# Altium project Proyecto3.PrjPcb
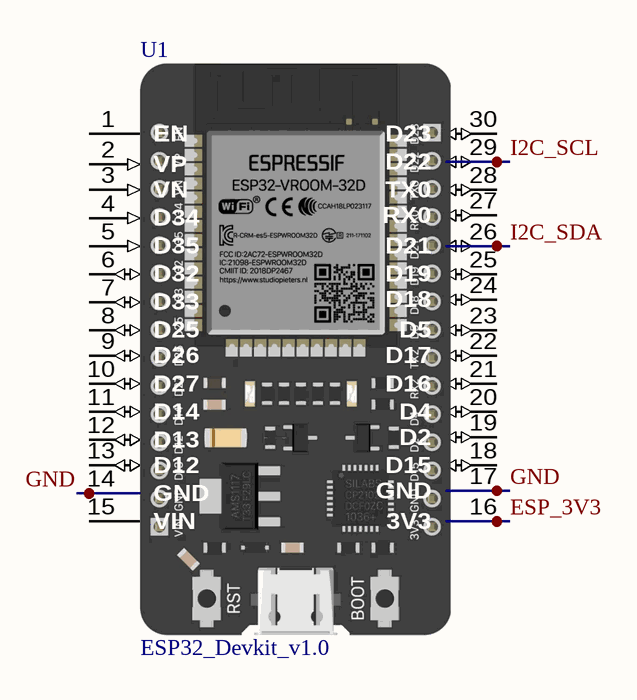
[diagram p0: 01_ESP32_Maestro.SchDoc]
5 sheets, 38 parts. Net scope: global (net labels, ports and power ports of the same name join across sheets).
Sheets:
  01_ESP32_Maestro.SchDoc
  02_Nucleo_1.SchDoc
  03_Nucleo_2.SchDoc
  04_TFT_Display_NeoPixel.SchDoc
  05_LEDs_Alimentacion.SchDoc

## Sheet 01_ESP32_Maestro.SchDoc: 01_ESP32_Maestro.SchDoc
size Letter; Author: Miguel Donis; Organization: Altium Limited; Address1: L3, 12a Rodborough Rd; Address2: Frenchs Forest; Address3: NSW; Address4: Australia 2086; Revision: 1.0; SheetNumber: 1; SheetTotal: 5; Carnet: 22993; Curso: Digital 2; ProjectName: proyecto 3

### Parts
U1  ESP32_Devkit_v1.0  [ESP_32_DEKIT_V1.0]

### Nets
ESP_3V3: U1.16(3V3)
GND: U1.14(GND) U1.17(GND)
I2C_SCL: U1.29(D22)
I2C_SDA: U1.26(D21)

Not connected (* = marked no-connect by the designer): U1 1(EN) 2(VP) 3(VN) 4(D34) 5(D35) 6(D32) 7(D33) 8(D25) 9(D26) 10(D27) 11(D14) 12(D13) 13(D12) 15(VIN) 18(D15) 19(D2) 20(D4) 21(D16) 22(D17) 23(D5) 24(D18) 25(D19) 27(RX0) 28(TX0) 30(D23)

### Notes on the sheet
- Proyecto:
- Autor:
- Documento:
- Carnet:
- Curso:
- Revision:
- Fecha:
- Tamaño:
- Carta
- Hoja:
- De:

### Library data of the parts
U1 = ESP32_Devkit_v1.0: ESP32 Development kit v1.0

## Sheet 02_Nucleo_1.SchDoc: 02_Nucleo_1.SchDoc
size Letter; Author: Miguel Donis; Organization: Altium Limited; Address1: L3, 12a Rodborough Rd; Address2: Frenchs Forest; Address3: NSW; Address4: Australia 2086; Revision: 1.0; SheetNumber: 2; SheetTotal: 5; Carnet: 22993; Curso: Digital 2; ProjectName: proyecto 3
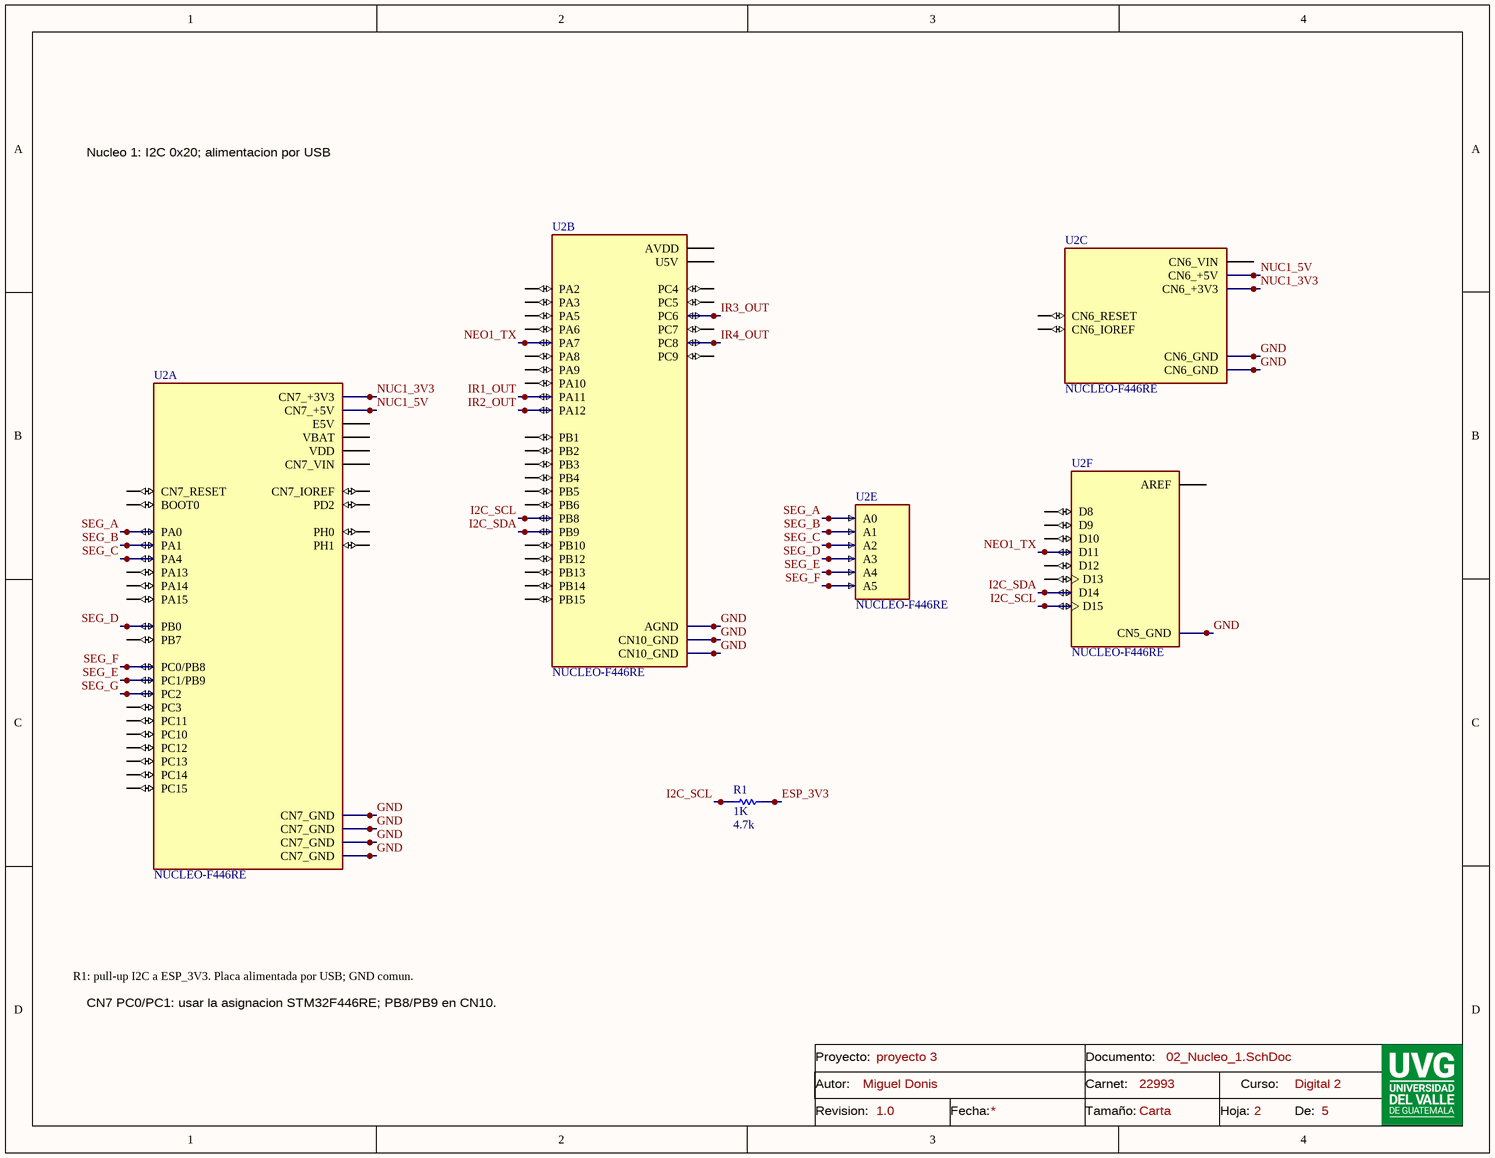
[diagram p1: 02_Nucleo_1.SchDoc]

### Parts
R1  4.7k  value 1K  [AXIAL-0.3]
U2  NUCLEO-F446RE  [MODULE_NUCLEO-F446RE]  (parts A,B,C,E,F of 6)

### Nets
ESP_3V3: R1.2
GND: U2.CN5_7(CN5_GND) U2.CN6_6(CN6_GND) U2.CN6_7(CN6_GND) U2.CN7_8(CN7_GND) U2.CN7_19(CN7_GND) U2.CN7_20(CN7_GND) U2.CN7_22(CN7_GND) U2.CN10_9(CN10_GND) U2.CN10_20(CN10_GND) U2.CN10_32(AGND)
I2C_SCL: R1.1 U2.CN5_10(D15) U2.CN10_3(PB8)
I2C_SDA: U2.CN5_9(D14) U2.CN10_5(PB9)
IR1_OUT: U2.CN10_14(PA11)
IR2_OUT: U2.CN10_12(PA12)
IR3_OUT: U2.CN10_4(PC6)
IR4_OUT: U2.CN10_2(PC8)
NEO1_TX: U2.CN5_4(D11) U2.CN10_15(PA7)
NUC1_3V3: U2.CN6_4(CN6_+3V3) U2.CN7_16(CN7_+3V3)
NUC1_5V: U2.CN6_5(CN6_+5V) U2.CN7_18(CN7_+5V)
SEG_A: U2.CN7_28(PA0) U2.CN8_1(A0)
SEG_B: U2.CN7_30(PA1) U2.CN8_2(A1)
SEG_C: U2.CN7_32(PA4) U2.CN8_3(A2)
SEG_D: U2.CN7_34(PB0) U2.CN8_4(A3)
SEG_E: U2.CN7_36(PC1/PB9) U2.CN8_5(A4)
SEG_F: U2.CN7_38(PC0/PB8) U2.CN8_6(A5)
SEG_G: U2.CN7_35(PC2)

Not connected (* = marked no-connect by the designer): U2 CN5_1(D8) CN5_2(D9) CN5_3(D10) CN5_5(D12) CN5_6(D13) CN5_8(AREF) CN6_2(CN6_IOREF) CN6_3(CN6_RESET) CN6_8(CN6_VIN) CN7_1(PC10) CN7_2(PC11) CN7_3(PC12) CN7_4(PD2) CN7_5(VDD) CN7_6(E5V) CN7_7(BOOT0) CN7_12(CN7_IOREF) CN7_13(PA13) CN7_14(CN7_RESET) CN7_15(PA14) CN7_17(PA15) CN7_21(PB7) CN7_23(PC13) CN7_24(CN7_VIN) CN7_25(PC14) CN7_27(PC15) CN7_29(PH0) CN7_31(PH1) CN7_33(VBAT) CN7_37(PC3) CN10_1(PC9) CN10_6(PC5) CN10_7(AVDD) CN10_8(U5V) CN10_11(PA5) CN10_13(PA6) CN10_16(PB12) CN10_17(PB6) CN10_19(PC7) CN10_21(PA9) CN10_22(PB2) CN10_23(PA8) CN10_24(PB1) CN10_25(PB10) CN10_26(PB15) CN10_27(PB4) CN10_28(PB14) CN10_29(PB5) CN10_30(PB13) CN10_31(PB3) CN10_33(PA10) CN10_34(PC4) CN10_35(PA2) CN10_37(PA3)

### Notes on the sheet
- Nucleo 1: I2C 0x20; alimentacion por USB
- R1: pull-up I2C a ESP_3V3. Placa alimentada por USB; GND comun.
- CN7 PC0/PC1: usar la asignacion STM32F446RE; PB8/PB9 en CN10.
- Proyecto:
- Autor:
- Documento:
- Carnet:
- Curso:
- Revision:
- Fecha:
- Tamaño:
- Carta
- Hoja:
- De:

### Library data of the parts
R1 = Res1: Resistor; Published: 8-Jun-2000; LatestRevisionDate: 17-Jul-2002; LatestRevisionNote: Re-released for DXP Platform.; PackageReference: AXIAL-0.3; Publisher: Altium Limited; PackageDescription: Axial Device, Thru-Hole; 2 Leads; 0.3 in Pin Spacing
U2 = NUCLEO-F446RE: STM32F446RE, mbed-Enabled Development Nucleo-64 STM32F4 ARMÂ® CortexÂ®-M4 MCU 32-Bit Embedded Evaluation Board; MF: STMicroelectronics; SnapEDA_Link: https://www.snapeda.com/parts/NUCLEO-F446RE/STMicroelectronics/view-part/?ref=snap; Package: None; Value: *; MP: NUCLEO-F446RE; Check_prices: https://www.snapeda.com/parts/NUCLEO-F446RE/STMicroelectronics/view-part/?ref=eda

## Sheet 03_Nucleo_2.SchDoc: 03_Nucleo_2.SchDoc
size Letter; Author: Miguel Donis; Organization: Altium Limited; Address1: L3, 12a Rodborough Rd; Address2: Frenchs Forest; Address3: NSW; Address4: Australia 2086; Revision: 1.0; SheetNumber: 3; SheetTotal: 5; Carnet: 22993; Curso: Digital 2; ProjectName: proyecto 3
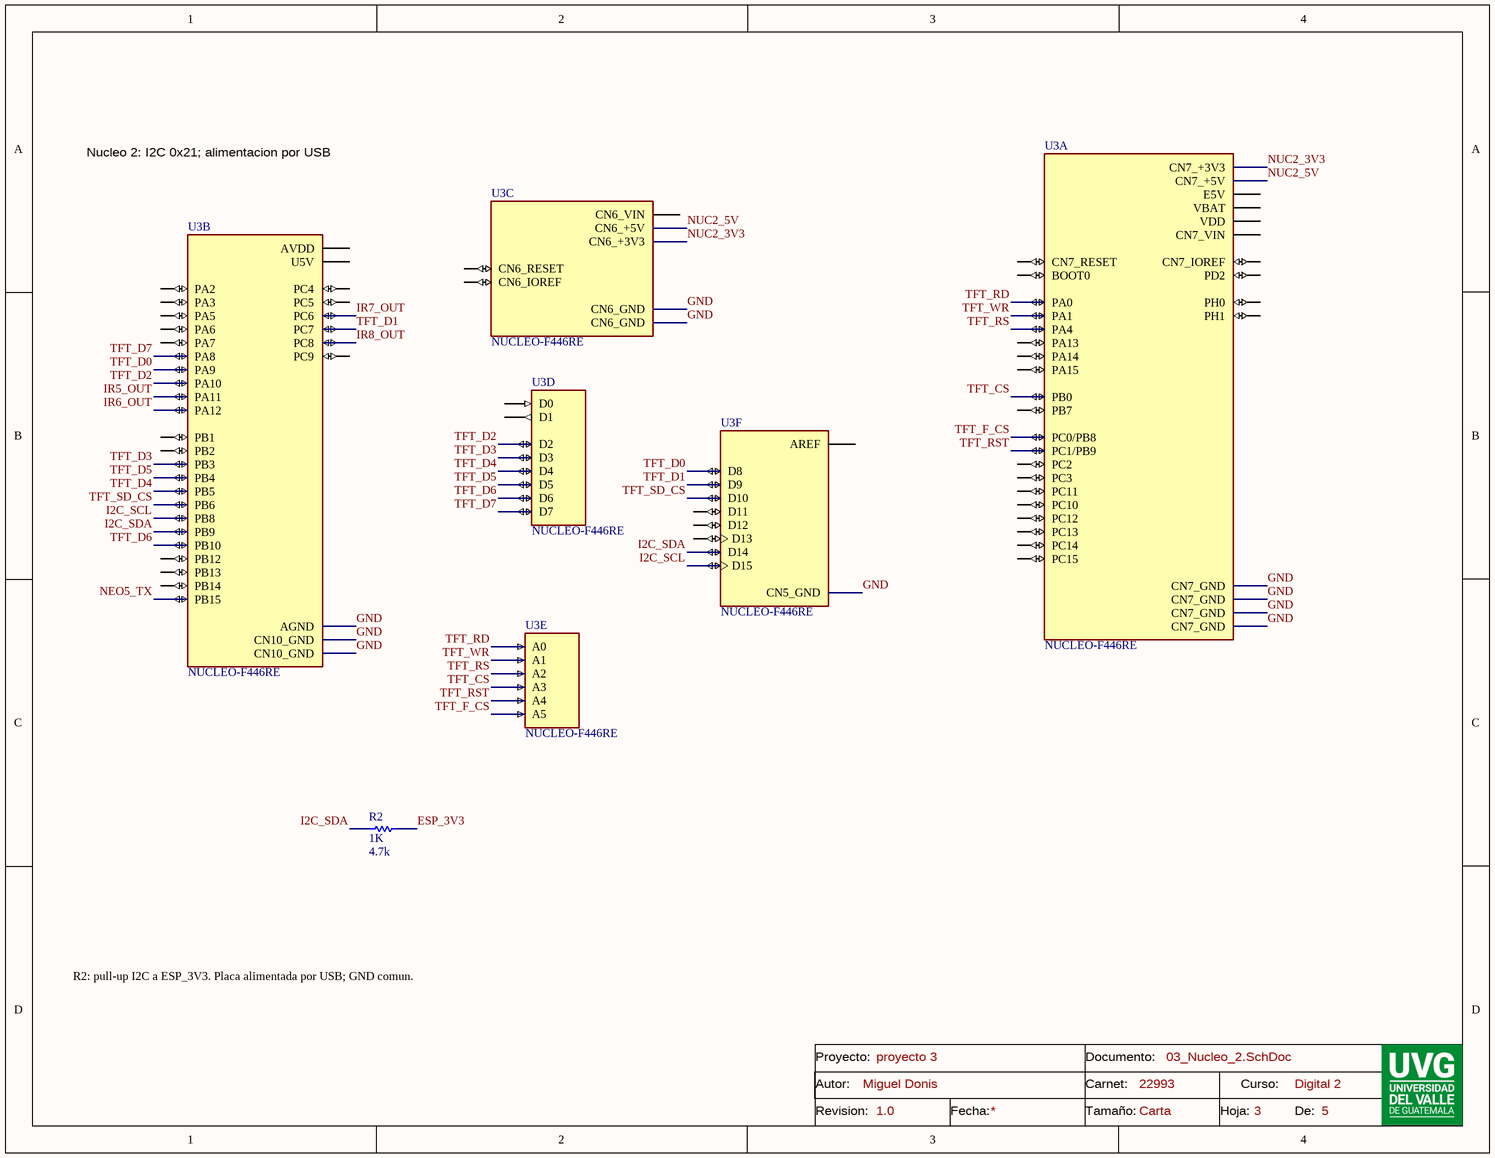
[diagram p2: 03_Nucleo_2.SchDoc]

### Parts
R2  4.7k  value 1K  [AXIAL-0.3]
U3  NUCLEO-F446RE  [MODULE_NUCLEO-F446RE]  (parts A,B,C,D,E,F of 6)

### Nets
ESP_3V3: R2.2
GND: U3.CN5_7(CN5_GND) U3.CN6_6(CN6_GND) U3.CN6_7(CN6_GND) U3.CN7_8(CN7_GND) U3.CN7_19(CN7_GND) U3.CN7_20(CN7_GND) U3.CN7_22(CN7_GND) U3.CN10_9(CN10_GND) U3.CN10_20(CN10_GND) U3.CN10_32(AGND)
I2C_SCL: U3.CN5_10(D15) U3.CN10_3(PB8)
I2C_SDA: R2.1 U3.CN5_9(D14) U3.CN10_5(PB9)
IR5_OUT: U3.CN10_14(PA11)
IR6_OUT: U3.CN10_12(PA12)
IR7_OUT: U3.CN10_4(PC6)
IR8_OUT: U3.CN10_2(PC8)
NEO5_TX: U3.CN10_26(PB15)
NUC2_3V3: U3.CN6_4(CN6_+3V3) U3.CN7_16(CN7_+3V3)
NUC2_5V: U3.CN6_5(CN6_+5V) U3.CN7_18(CN7_+5V)
TFT_CS: U3.CN7_34(PB0) U3.CN8_4(A3)
TFT_D0: U3.CN5_1(D8) U3.CN10_21(PA9)
TFT_D1: U3.CN5_2(D9) U3.CN10_19(PC7)
TFT_D2: U3.CN9_3(D2) U3.CN10_33(PA10)
TFT_D3: U3.CN9_4(D3) U3.CN10_31(PB3)
TFT_D4: U3.CN9_5(D4) U3.CN10_29(PB5)
TFT_D5: U3.CN9_6(D5) U3.CN10_27(PB4)
TFT_D6: U3.CN9_7(D6) U3.CN10_25(PB10)
TFT_D7: U3.CN9_8(D7) U3.CN10_23(PA8)
TFT_F_CS: U3.CN7_38(PC0/PB8) U3.CN8_6(A5)
TFT_RD: U3.CN7_28(PA0) U3.CN8_1(A0)
TFT_RS: U3.CN7_32(PA4) U3.CN8_3(A2)
TFT_RST: U3.CN7_36(PC1/PB9) U3.CN8_5(A4)
TFT_SD_CS: U3.CN5_3(D10) U3.CN10_17(PB6)
TFT_WR: U3.CN7_30(PA1) U3.CN8_2(A1)

Not connected (* = marked no-connect by the designer): U3 CN5_4(D11) CN5_5(D12) CN5_6(D13) CN5_8(AREF) CN6_2(CN6_IOREF) CN6_3(CN6_RESET) CN6_8(CN6_VIN) CN7_1(PC10) CN7_2(PC11) CN7_3(PC12) CN7_4(PD2) CN7_5(VDD) CN7_6(E5V) CN7_7(BOOT0) CN7_12(CN7_IOREF) CN7_13(PA13) CN7_14(CN7_RESET) CN7_15(PA14) CN7_17(PA15) CN7_21(PB7) CN7_23(PC13) CN7_24(CN7_VIN) CN7_25(PC14) CN7_27(PC15) CN7_29(PH0) CN7_31(PH1) CN7_33(VBAT) CN7_35(PC2) CN7_37(PC3) CN9_1(D0) CN9_2(D1) CN10_1(PC9) CN10_6(PC5) CN10_7(AVDD) CN10_8(U5V) CN10_11(PA5) CN10_13(PA6) CN10_15(PA7) CN10_16(PB12) CN10_22(PB2) CN10_24(PB1) CN10_28(PB14) CN10_30(PB13) CN10_34(PC4) CN10_35(PA2) CN10_37(PA3)

### Notes on the sheet
- Nucleo 2: I2C 0x21; alimentacion por USB
- R2: pull-up I2C a ESP_3V3. Placa alimentada por USB; GND comun.
- Proyecto:
- Autor:
- Documento:
- Carnet:
- Curso:
- Revision:
- Fecha:
- Tamaño:
- Carta
- Hoja:
- De:

### Library data of the parts
R2 = Res1: Resistor; Published: 8-Jun-2000; LatestRevisionDate: 17-Jul-2002; LatestRevisionNote: Re-released for DXP Platform.; PackageReference: AXIAL-0.3; Publisher: Altium Limited; PackageDescription: Axial Device, Thru-Hole; 2 Leads; 0.3 in Pin Spacing
U3 = NUCLEO-F446RE: as U2 on sheet 02_Nucleo_1; SnapEDA_Link: https://www.snapeda.com/parts/NUCLEO-F446RE/STMicroelectronics/view-part/?ref=snap; Package: None; Value: *; MP: NUCLEO-F446RE; Check_prices: https://www.snapeda.com/parts/NUCLEO-F446RE/STMicroelectronics/view-part/?ref=eda

## Sheet 04_TFT_Display_NeoPixel.SchDoc: 04_TFT_Display_NeoPixel.SchDoc
size Letter; Author: Miguel Donis; Organization: Altium Limited; Address1: L3, 12a Rodborough Rd; Address2: Frenchs Forest; Address3: NSW; Address4: Australia 2086; Revision: 1.0; SheetNumber: 4; SheetTotal: 5; Carnet: 22993; Curso: Digital 2; ProjectName: proyecto 3
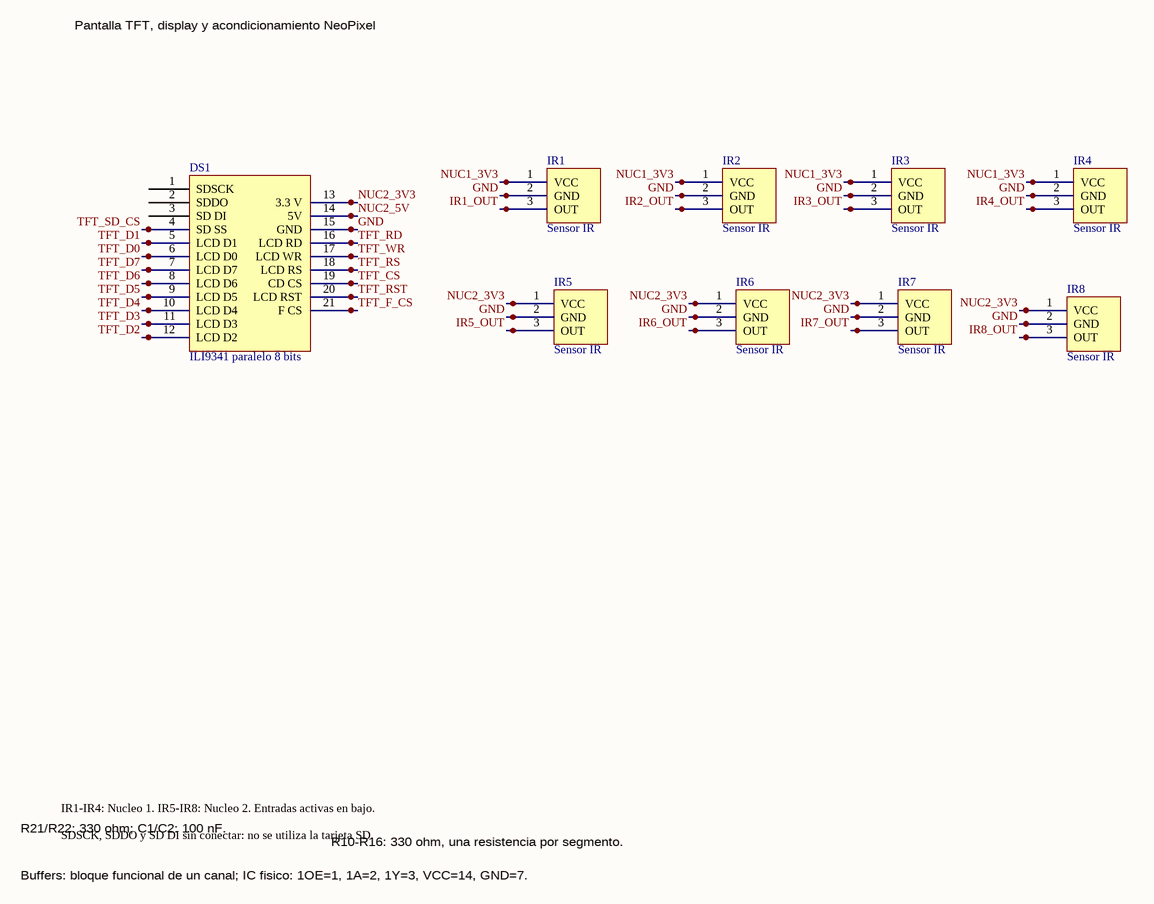
[diagram p3: 04_TFT_Display_NeoPixel.SchDoc]

### Parts
DS1  ILI9341 paralelo 8 bits
IR1  Sensor IR
IR2  Sensor IR
IR3  Sensor IR
IR4  Sensor IR
IR5  Sensor IR
IR6  Sensor IR
IR7  Sensor IR
IR8  Sensor IR

### Nets
GND: DS1.15(GND) IR1.2(GND) IR2.2(GND) IR3.2(GND) IR4.2(GND) IR5.2(GND) IR6.2(GND) IR7.2(GND) IR8.2(GND)
IR1_OUT: IR1.3(OUT)
IR2_OUT: IR2.3(OUT)
IR3_OUT: IR3.3(OUT)
IR4_OUT: IR4.3(OUT)
IR5_OUT: IR5.3(OUT)
IR6_OUT: IR6.3(OUT)
IR7_OUT: IR7.3(OUT)
IR8_OUT: IR8.3(OUT)
NUC1_3V3: IR1.1(VCC) IR2.1(VCC) IR3.1(VCC) IR4.1(VCC)
NUC2_3V3: DS1.13(3.3_V) IR5.1(VCC) IR6.1(VCC) IR7.1(VCC) IR8.1(VCC)
NUC2_5V: DS1.14(5V)
TFT_CS: DS1.19(CD_CS)
TFT_D0: DS1.6(LCD_D0)
TFT_D1: DS1.5(LCD_D1)
TFT_D2: DS1.12(LCD_D2)
TFT_D3: DS1.11(LCD_D3)
TFT_D4: DS1.10(LCD_D4)
TFT_D5: DS1.9(LCD_D5)
TFT_D6: DS1.8(LCD_D6)
TFT_D7: DS1.7(LCD_D7)
TFT_F_CS: DS1.21(F_CS)
TFT_RD: DS1.16(LCD_RD)
TFT_RS: DS1.18(LCD_RS)
TFT_RST: DS1.20(LCD_RST)
TFT_SD_CS: DS1.4(SD_SS)
TFT_WR: DS1.17(LCD_WR)

Not connected (* = marked no-connect by the designer): DS1 1(SDSCK) 2(SDDO) 3(SD_DI)

### Notes on the sheet
- Pantalla TFT, display y acondicionamiento NeoPixel
- R21/R22: 330 ohm; C1/C2: 100 nF.
- IR1-IR4: Nucleo 1. IR5-IR8: Nucleo 2. Entradas activas en bajo.
- SDSCK, SDDO y SD DI sin conectar: no se utiliza la tarjeta SD.
- R10-R16: 330 ohm, una resistencia por segmento.
- Buffers: bloque funcional de un canal; IC fisico: 1OE=1, 1A=2, 1Y=3, VCC=14, GND=7.
- Proyecto:
- Autor:
- Documento:
- Carnet:
- Curso:
- Revision:
- Fecha:
- Tamaño:
- Carta
- Hoja:
- De:

### Library data of the parts
DS1 = ili

## Sheet 05_LEDs_Alimentacion.SchDoc: 05_LEDs_Alimentacion.SchDoc
size Letter; Author: Miguel Donis; Organization: Altium Limited; Address1: L3, 12a Rodborough Rd; Address2: Frenchs Forest; Address3: NSW; Address4: Australia 2086; Revision: 1.0; SheetNumber: 5; SheetTotal: 5; Carnet: 22993; Curso: Digital 2; ProjectName: proyecto 3
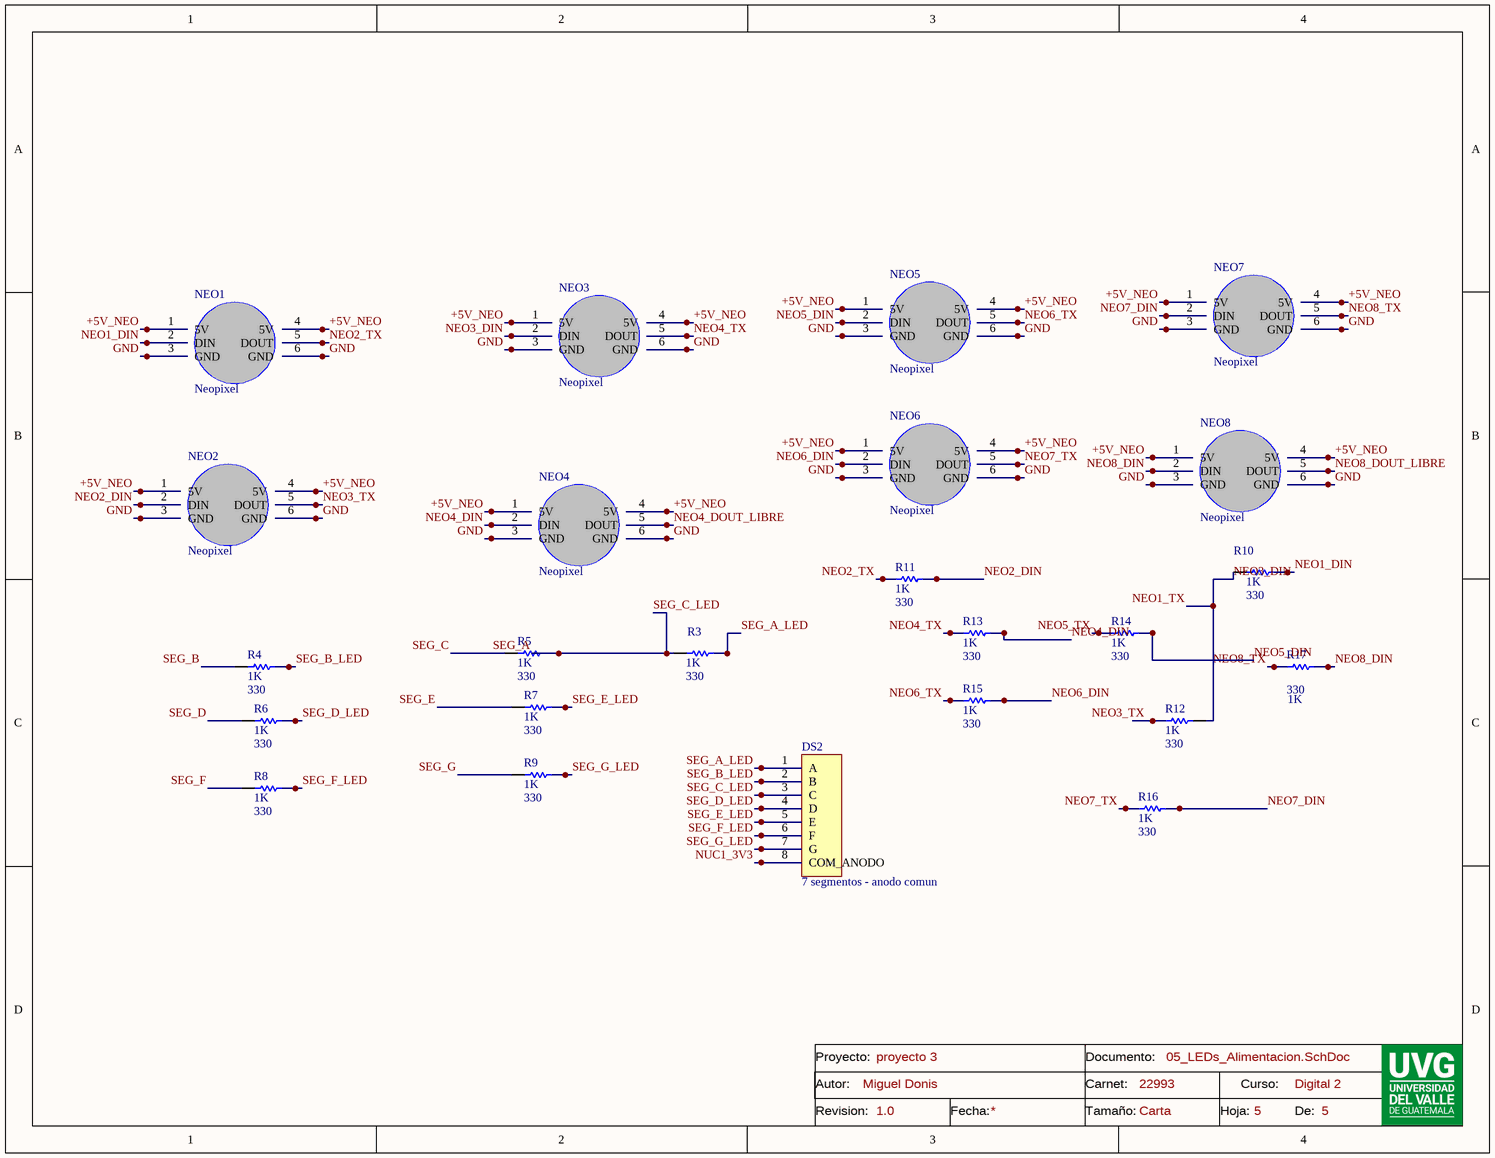
[diagram p4: 05_LEDs_Alimentacion.SchDoc]

### Parts
DS2  7 segmentos - anodo comun
NEO1  Neopixel
NEO2  Neopixel
NEO3  Neopixel
NEO4  Neopixel
NEO5  Neopixel
NEO6  Neopixel
NEO7  Neopixel
NEO8  Neopixel
R3  330  value 1K  [AXIAL-0.3]
R4  330  value 1K  [AXIAL-0.3]
R5  330  value 1K  [AXIAL-0.3]
R6  330  value 1K  [AXIAL-0.3]
R7  330  value 1K  [AXIAL-0.3]
R8  330  value 1K  [AXIAL-0.3]
R9  330  value 1K  [AXIAL-0.3]
R10  330  value 1K  [AXIAL-0.3]
R11  330  value 1K  [AXIAL-0.3]
R12  330  value 1K  [AXIAL-0.3]
R13  330  value 1K  [AXIAL-0.3]
R14  330  value 1K  [AXIAL-0.3]
R15  330  value 1K  [AXIAL-0.3]
R16  330  value 1K  [AXIAL-0.3]
R17  330  value 1K  [AXIAL-0.3]

### Nets
+5V_NEO: NEO1.1(5V) NEO1.4(5V) NEO2.1(5V) NEO2.4(5V) NEO3.1(5V) NEO3.4(5V) NEO4.1(5V) NEO4.4(5V) NEO5.1(5V) NEO5.4(5V) NEO6.1(5V) NEO6.4(5V) NEO7.1(5V) NEO7.4(5V) NEO8.1(5V) NEO8.4(5V)
GND: NEO1.3(GND) NEO1.6(GND) NEO2.3(GND) NEO2.6(GND) NEO3.3(GND) NEO3.6(GND) NEO4.3(GND) NEO4.6(GND) NEO5.3(GND) NEO5.6(GND) NEO6.3(GND) NEO6.6(GND) NEO7.3(GND) NEO7.6(GND) NEO8.3(GND) NEO8.6(GND)
NEO1_DIN: NEO1.2(DIN) R10.2
NEO1_TX: NEO3.2(DIN) R10.1 R12.2  [also labelled NEO3_DIN]
NEO2_DIN: NEO2.2(DIN) R11.2
NEO2_TX: NEO1.5(DOUT) R11.1
NEO3_TX: NEO2.5(DOUT) R12.1
NEO4_DIN: NEO4.2(DIN) R13.2
NEO4_DOUT_LIBRE: NEO4.5(DOUT)
NEO4_TX: NEO3.5(DOUT) R13.1
NEO5_DIN: NEO5.2(DIN) R14.2
NEO5_TX: R14.1
NEO6_DIN: NEO6.2(DIN) R15.2
NEO6_TX: NEO5.5(DOUT) R15.1
NEO7_DIN: NEO7.2(DIN) R16.2
NEO7_TX: NEO6.5(DOUT) R16.1
NEO8_DIN: NEO8.2(DIN) R17.2
NEO8_DOUT_LIBRE: NEO8.5(DOUT)
NEO8_TX: NEO7.5(DOUT) R17.1
NUC1_3V3: DS2.8(COM_ANODO)
SEG_A: DS2.3(C) R3.1 R5.2  [also labelled SEG_C_LED]
SEG_A_LED: DS2.1(A) R3.2
SEG_B: R4.1
SEG_B_LED: DS2.2(B) R4.2
SEG_C: R5.1
SEG_D: R6.1
SEG_D_LED: DS2.4(D) R6.2
SEG_E: R7.1
SEG_E_LED: DS2.5(E) R7.2
SEG_F: R8.1
SEG_F_LED: DS2.6(F) R8.2
SEG_G: R9.1
SEG_G_LED: DS2.7(G) R9.2

### Notes on the sheet
- Proyecto:
- Autor:
- Documento:
- Carnet:
- Curso:
- Revision:
- Fecha:
- Tamaño:
- Carta
- Hoja:
- De:

### Library data of the parts
DS2 = 7SEG
R3-R17 = Res1: Resistor; Published: 8-Jun-2000; LatestRevisionDate: 17-Jul-2002; LatestRevisionNote: Re-released for DXP Platform.; PackageReference: AXIAL-0.3; Publisher: Altium Limited; PackageDescription: Axial Device, Thru-Hole; 2 Leads; 0.3 in Pin Spacing

## Nets that join several sheets
ESP_3V3: 01_ESP32_Maestro (U1.16), 02_Nucleo_1 (R1.2), 03_Nucleo_2 (R2.2)
GND: 01_ESP32_Maestro (U1.14 U1.17), 02_Nucleo_1 (10 pins), 03_Nucleo_2 (10 pins), 04_TFT_Display_NeoPixel (9 pins), 05_LEDs_Alimentacion (16 pins)
I2C_SCL: 01_ESP32_Maestro (U1.29), 02_Nucleo_1 (R1.1 U2.CN5_10 U2.CN10_3), 03_Nucleo_2 (U3.CN5_10 U3.CN10_3)
I2C_SDA: 01_ESP32_Maestro (U1.26), 02_Nucleo_1 (U2.CN5_9 U2.CN10_5), 03_Nucleo_2 (R2.1 U3.CN5_9 U3.CN10_5)
IR1_OUT: 02_Nucleo_1 (U2.CN10_14), 04_TFT_Display_NeoPixel (IR1.3)
IR2_OUT: 02_Nucleo_1 (U2.CN10_12), 04_TFT_Display_NeoPixel (IR2.3)
IR3_OUT: 02_Nucleo_1 (U2.CN10_4), 04_TFT_Display_NeoPixel (IR3.3)
IR4_OUT: 02_Nucleo_1 (U2.CN10_2), 04_TFT_Display_NeoPixel (IR4.3)
IR5_OUT: 03_Nucleo_2 (U3.CN10_14), 04_TFT_Display_NeoPixel (IR5.3)
IR6_OUT: 03_Nucleo_2 (U3.CN10_12), 04_TFT_Display_NeoPixel (IR6.3)
IR7_OUT: 03_Nucleo_2 (U3.CN10_4), 04_TFT_Display_NeoPixel (IR7.3)
IR8_OUT: 03_Nucleo_2 (U3.CN10_2), 04_TFT_Display_NeoPixel (IR8.3)
NEO1_TX: 02_Nucleo_1 (U2.CN5_4 U2.CN10_15), 05_LEDs_Alimentacion (NEO3.2 R10.1 R12.2)
NEO5_TX: 03_Nucleo_2 (U3.CN10_26), 05_LEDs_Alimentacion (R14.1)
NUC1_3V3: 02_Nucleo_1 (U2.CN6_4 U2.CN7_16), 04_TFT_Display_NeoPixel (IR1.1 IR2.1 IR3.1 IR4.1), 05_LEDs_Alimentacion (DS2.8)
NUC2_3V3: 03_Nucleo_2 (U3.CN6_4 U3.CN7_16), 04_TFT_Display_NeoPixel (5 pins)
NUC2_5V: 03_Nucleo_2 (U3.CN6_5 U3.CN7_18), 04_TFT_Display_NeoPixel (DS1.14)
SEG_A: 02_Nucleo_1 (U2.CN7_28 U2.CN8_1), 05_LEDs_Alimentacion (DS2.3 R3.1 R5.2)
SEG_B: 02_Nucleo_1 (U2.CN7_30 U2.CN8_2), 05_LEDs_Alimentacion (R4.1)
SEG_C: 02_Nucleo_1 (U2.CN7_32 U2.CN8_3), 05_LEDs_Alimentacion (R5.1)
SEG_D: 02_Nucleo_1 (U2.CN7_34 U2.CN8_4), 05_LEDs_Alimentacion (R6.1)
SEG_E: 02_Nucleo_1 (U2.CN7_36 U2.CN8_5), 05_LEDs_Alimentacion (R7.1)
SEG_F: 02_Nucleo_1 (U2.CN7_38 U2.CN8_6), 05_LEDs_Alimentacion (R8.1)
SEG_G: 02_Nucleo_1 (U2.CN7_35), 05_LEDs_Alimentacion (R9.1)
TFT_CS: 03_Nucleo_2 (U3.CN7_34 U3.CN8_4), 04_TFT_Display_NeoPixel (DS1.19)
TFT_D0: 03_Nucleo_2 (U3.CN5_1 U3.CN10_21), 04_TFT_Display_NeoPixel (DS1.6)
TFT_D1: 03_Nucleo_2 (U3.CN5_2 U3.CN10_19), 04_TFT_Display_NeoPixel (DS1.5)
TFT_D2: 03_Nucleo_2 (U3.CN9_3 U3.CN10_33), 04_TFT_Display_NeoPixel (DS1.12)
TFT_D3: 03_Nucleo_2 (U3.CN9_4 U3.CN10_31), 04_TFT_Display_NeoPixel (DS1.11)
TFT_D4: 03_Nucleo_2 (U3.CN9_5 U3.CN10_29), 04_TFT_Display_NeoPixel (DS1.10)
TFT_D5: 03_Nucleo_2 (U3.CN9_6 U3.CN10_27), 04_TFT_Display_NeoPixel (DS1.9)
TFT_D6: 03_Nucleo_2 (U3.CN9_7 U3.CN10_25), 04_TFT_Display_NeoPixel (DS1.8)
TFT_D7: 03_Nucleo_2 (U3.CN9_8 U3.CN10_23), 04_TFT_Display_NeoPixel (DS1.7)
TFT_F_CS: 03_Nucleo_2 (U3.CN7_38 U3.CN8_6), 04_TFT_Display_NeoPixel (DS1.21)
TFT_RD: 03_Nucleo_2 (U3.CN7_28 U3.CN8_1), 04_TFT_Display_NeoPixel (DS1.16)
TFT_RS: 03_Nucleo_2 (U3.CN7_32 U3.CN8_3), 04_TFT_Display_NeoPixel (DS1.18)
TFT_RST: 03_Nucleo_2 (U3.CN7_36 U3.CN8_5), 04_TFT_Display_NeoPixel (DS1.20)
TFT_SD_CS: 03_Nucleo_2 (U3.CN5_3 U3.CN10_17), 04_TFT_Display_NeoPixel (DS1.4)
TFT_WR: 03_Nucleo_2 (U3.CN7_30 U3.CN8_2), 04_TFT_Display_NeoPixel (DS1.17)